# Altium schematic sheet altium-ascii-1e308.SchDoc
size E
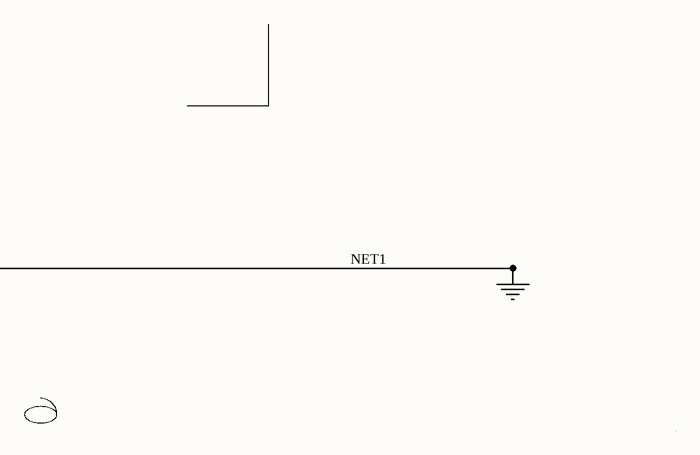
[diagram p0: altium-ascii-1e308.SchDoc]

## Parts
?  (no value)

## Sub-sheets
? = ?: no entries

## Notes on the sheet
- Labels drawn without touching a wire or pin: NET1

## Library data of the parts
? = RES